# Altium schematic sheet LAN - RTL8111H.schdoc
size 420 x 298 mm; Symbol: Sheet-Symbol_A3; Company: 嘉立创EDA; Version: V1.0; Page Size: A3; @Project Name: 【全网首发】X86电脑主板_copy; @Page Count: 15; @Update Date: 2025-10-09; @Create Date: 2025-10-09; @Schematic Name: SCHEMATIC1_1; @Page No: 0; @Page Name: LAN - RTL8111H; Device: Sheet-Symbol_A3
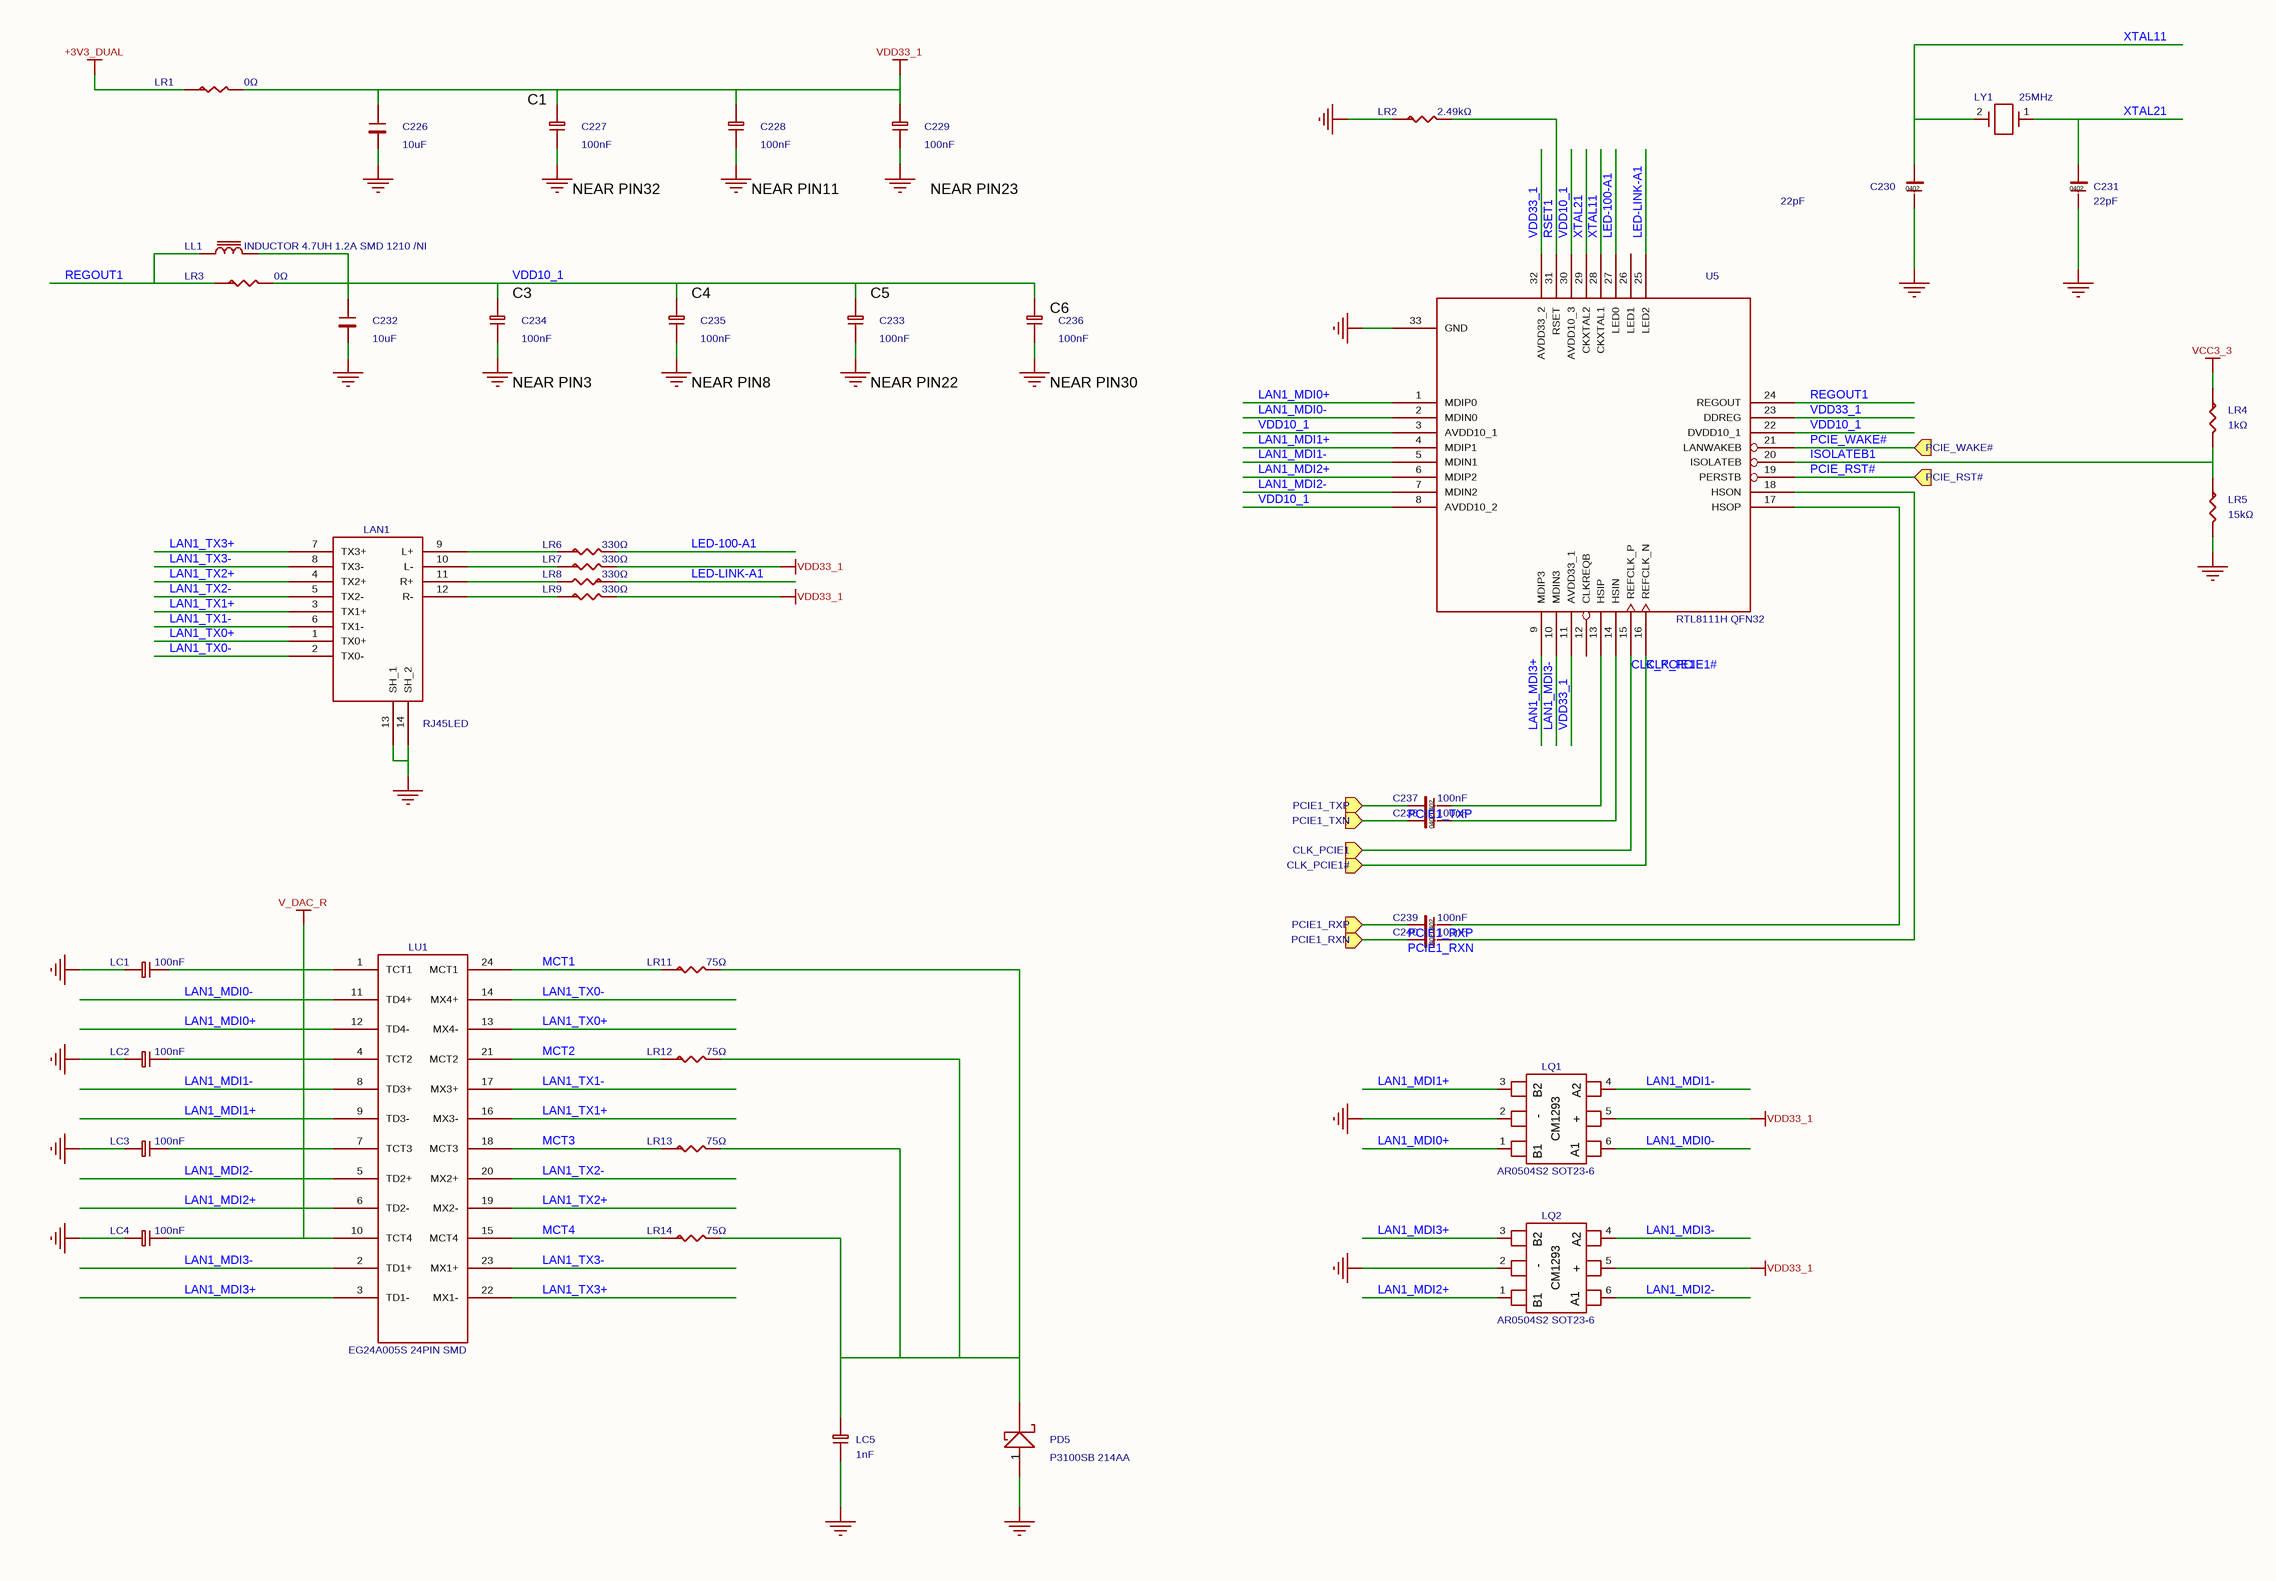
[diagram p0: LAN - RTL8111H.schdoc]

## Parts
C226  10uF  [C0603]
C227  100nF  [C0402]
C228  100nF  [C0402_3]
C229  100nF  [C0402_2]
C230  22pF  [C0402]
C231  22pF  [C0402]
C232  10uF  [C0603_3]
C233  100nF  [C0402_3]
C234  100nF  [C0402_2]
C235  100nF  [C0402_1]
C236  100nF  [C0402_1]
C237  100nF  [C0402_3]
C238  100nF  [C0402_3]
C239  100nF  [C0402_3]
C240  100nF  [C0402_3]
LAN1  value RJ45LED  [RJ45_LED]  (hidden comment: R-RJ45R08P-C000)
LC1  100nF  [C0402]
LC2  100nF  [C0402]
LC3  100nF  [C0402]
LC4  100nF  [C0402]
LC5  1nF  [C1206]
LL1  value INDUCTOR 4.7UH 1.2A SMD 1210 /NI  [L1210H22]  (hidden comment: INDUCTOR_0)
LQ1  value AR0504S2 SOT23-6  [SOT23-6P-20051228]  (hidden comment: SRV05-4)
LQ2  value AR0504S2 SOT23-6  [SOT23-6P-20051228]  (hidden comment: SRV05-4)
LR1  0Ω  [R0603]
LR2  2.49kΩ  [R0402]
LR3  0Ω  [R0603_1]
LR4  1kΩ  [R0402_1]
LR5  15kΩ  [R0402_3]
LR6  330Ω  [R0402_3]
LR7  330Ω  [R0402_1]
LR8  330Ω  [R0402_1]
LR9  330Ω  [R0402_1]
LR11  75Ω  [R0402_3]
LR12  75Ω  [R0402_1]
LR13  75Ω  [R0402_1]
LR14  75Ω  [R0402_1]
LU1  value EG24A005S 24PIN SMD  [TRAN24_100_150]  (hidden comment: RJ45LED_3)
LY1  25MHz  [XD2]
PD5  value P3100SB 214AA  [DIODE_1N5817]  (hidden comment: P3100SB)
U5  value RTL8111H QFN32  [RTL8111G_QFN32]  (hidden comment: RTL8111H-CG)

## Ports
CLK_PCIE1 (in), CLK_PCIE1# (in), PCIE1_RXN (in), PCIE1_RXP (in), PCIE1_TXN (in), PCIE1_TXP (in), PCIE_RST# (in), PCIE_WAKE# (in)

## Nets
+3V3_DUAL: LR1.1
GND: C226.1 C227.1 C228.1 C229.1 C230.2 C231.2 C232.1 C233.1 C234.1 C235.1 C236.1 LAN1.13(SH_1) LAN1.14(SH_2) LC1.2 LC2.2 LC3.2 LC4.2 LC5.1 LQ1.2 LQ2.2 LR2.1 LR5.2 PD5.1(A) U5.33(GND)
V_DAC_R: LC1.1 LC2.1 LC3.1 LC4.1 LU1.1(TCT1) LU1.4(TCT2) LU1.7(TCT3) LU1.10(TCT4)
VCC3_3: LR4.1
VDD33_1: C226.2 C227.2 C228.2 C229.2 LQ1.5(+) LQ2.5(+) LR1.2 LR7.2 LR9.2 U5.11(AVDD33_1) U5.23(DDREG) U5.32(AVDD33_2)
CLK_PCIE1: U5.15(REFCLK_P) ; port CLK_PCIE1
CLK_PCIE1#: U5.16(REFCLK_N) ; port CLK_PCIE1#
ISOLATEB1: LR4.2 LR5.1 U5.20(ISOLATEB)
LAN1_MDI0+: LQ1.1 LU1.12(TD4-) U5.1(MDIP0)
LAN1_MDI0-: LQ1.6 LU1.11(TD4+) U5.2(MDIN0)
LAN1_MDI1+: LQ1.3 LU1.9(TD3-) U5.4(MDIP1)
LAN1_MDI1-: LQ1.4 LU1.8(TD3+) U5.5(MDIN1)
LAN1_MDI2+: LQ2.1 LU1.6(TD2-) U5.6(MDIP2)
LAN1_MDI2-: LQ2.6 LU1.5(TD2+) U5.7(MDIN2)
LAN1_MDI3+: LQ2.3 LU1.3(TD1-) U5.9(MDIP3)
LAN1_MDI3-: LQ2.4 LU1.2(TD1+) U5.10(MDIN3)
LAN1_TX0+: LAN1.1(TX0+) LU1.13(MX4-)
LAN1_TX0-: LAN1.2(TX0-) LU1.14(MX4+)
LAN1_TX1+: LAN1.3(TX1+) LU1.16(MX3-)
LAN1_TX1-: LAN1.6(TX1-) LU1.17(MX3+)
LAN1_TX2+: LAN1.4(TX2+) LU1.19(MX2-)
LAN1_TX2-: LAN1.5(TX2-) LU1.20(MX2+)
LAN1_TX3+: LAN1.7(TX3+) LU1.22(MX1-)
LAN1_TX3-: LAN1.8(TX3-) LU1.23(MX1+)
LED-100-A1: LR6.2 U5.27(LED0)
LED-LINK-A1: LR8.1 U5.25(LED2)
MCT1: LR11.1 LU1.24(MCT1)
MCT2: LR12.1 LU1.21(MCT2)
MCT3: LR13.1 LU1.18(MCT3)
MCT4: LR14.1 LU1.15(MCT4)
PCIE1_RXN: C240.1 ; port PCIE1_RXN
PCIE1_RXP: C239.1 ; port PCIE1_RXP
PCIE1_TXN: C238.1 ; port PCIE1_TXN
PCIE1_TXP: C237.1 ; port PCIE1_TXP
PCIE_RST#: U5.19(PERSTB) ; port PCIE_RST#
PCIE_WAKE#: U5.21(LANWAKEB) ; port PCIE_WAKE#
REGOUT1: LL1.1 LR3.1 U5.24(REGOUT)
RSET1: LR2.2 U5.31(RSET)
VDD10_1: C232.2 C233.2 C234.2 C235.2 C236.2 LL1.2 LR3.2 U5.3(AVDD10_1) U5.8(AVDD10_2) U5.22(DVDD10_1) U5.30(AVDD10_3)
XTAL11: C230.1 LY1.2 U5.28(CKXTAL1)
XTAL21: C231.1 LY1.1 U5.29(CKXTAL2)
NetC237_2: C237.2 U5.13(HSIP)
NetC238_2: C238.2 U5.14(HSIN)
NetC239_2: C239.2 U5.17(HSOP)
NetC240_2: C240.2 U5.18(HSON)
NetLAN1_9: LAN1.9(L+) LR6.1
NetLAN1_10: LAN1.10(L-) LR7.1
NetLAN1_11: LAN1.11(R+) LR8.2
NetLAN1_12: LAN1.12(R-) LR9.1
NetLC5_2: LC5.2 LR11.2 LR12.2 LR13.2 LR14.2 PD5.2(C)

Not connected (* = marked no-connect by the designer): U5 12(CLKREQB) 26(LED1)

## Notes on the sheet
- (near C227) C1
- (near C227) NEAR PIN32
- (near C228) NEAR PIN11
- (near C229) NEAR PIN23
- (near C234) C3
- (near C235) C4
- (near C233) C5
- (near C236) C6
- (near C234) NEAR PIN3
- (near C235) NEAR PIN8
- (near C233) NEAR PIN22
- (near C236) NEAR PIN30
- 更新日期
- 2025-10-09
- 原理图
- 图页
- SCHEMATIC1_1
- LAN - RTL8111H
- 创建日期
- 物料编码
- 审阅
- 绘制
- 【全网首发】X86电脑主板_copy
- 版本
- V1.0
- 尺寸
- A3
- 页
- 0
- 嘉立创EDA
- 共
- 15
- (in symbol SRV05-4_C558418) B2; A2; CM1293; -; B1; A1

## Library data of the parts
C226 C232 = CL10A106KP8NNNC: 容值:10uF;精度:±10%;额定电压:10V;材质(温度系数):X5R;; Manufacturer: SAMSUNG(三星); Symbol: C0805; ModelId: ac125912035d415993ca9572d50418b1; Tolerance: ±10%; AddInBom: yes; Voltage Rated: 10V; ModelName: C0603_L1.6-W0.8-H0.8; ModelTransform: 62.992,31.496,0,0,0,0,0,0,0; Temperature Coefficient: X5R; Device: CL10A106KP8NNNC; Value: 10uF; Supplier: LCSC; Datasheet: https://atta.szlcsc.com/upload/public/pdf/source/20160103/1457707703378.pdf; SupplierPart: C19702; ConvertToPcb: yes; LCSC Part Name: 10uF ±10% 10V; JLCPCB Part Class: Basic Part; ManufacturerPart: CL10A106KP8NNNC; Supplier Footprint: 0603
  C226: FootprintName: C0603
  C232: FootprintName: C0603_3
C227-C229 C233-C236 LC1-LC4 = CC0402KRX7R7BB104: 容值:100nF;精度:±10%;额定电压:16V;材质(温度系数):X7R;; Manufacturer: YAGEO(国巨); Symbol: CAP NP_21; ModelId: 36a51122f27c49738f86b3bfa98863e0; Tolerance: ±10%; AddInBom: yes; Voltage Rated: 16V; ModelName: C0402_L1.0-W0.5-H0.5; ModelTransform: 39.37,19.685,0,0,0,0,0,0,0; Temperature Coefficient: X7R; Device: CC0402KRX7R7BB104; Value: 100nF; Supplier: LCSC; Datasheet: https://atta.szlcsc.com/upload/public/pdf/source/20211223/9278FD768280B81DDBEF48FA36411A03.pdf; SupplierPart: C60474; ConvertToPcb: yes; LCSC Part Name: 100nF ±10% 16V; JLCPCB Part Class: Extended Part; ManufacturerPart: CC0402KRX7R7BB104; Supplier Footprint: 0402
  C227 LC1-LC4: FootprintName: C0402
  C228 C233: FootprintName: C0402_3
  C229 C234: FootprintName: C0402_2
  C235 C236: FootprintName: C0402_1
C230 C231 = 0402CG220J500NT: 容值:22pF;精度:±5%;额定电压:50V;材质(温度系数):C0G;; Manufacturer: FH(风华); ModelId: 36a51122f27c49738f86b3bfa98863e0; Tolerance: ±5%; AddInBom: yes; Voltage Rated: 50V; ModelName: C0402_L1.0-W0.5-H0.5; ModelTransform: 39.37,19.685,0,0,0,0,0,0,0; Temperature Coefficient: C0G; Device: 0402CG220J500NT; Symbol: C0402; Value: 22pF; Supplier: LCSC; Datasheet: https://atta.szlcsc.com/upload/public/pdf/source/20200305/C486355_26A10D38EF8C2A5C37091D0039909270.pdf; FootprintName: C0402; SupplierPart: C1555; ConvertToPcb: yes; LCSC Part Name: 22pF ±5% 50V; JLCPCB Part Class: Basic Part; ManufacturerPart: 0402CG220J500NT; Supplier Footprint: 0402
C237-C240 = CL05B104KO5NNNC: 容值:100nF;精度:±10%;额定电压:16V;材质(温度系数):X7R;; Manufacturer: SAMSUNG(三星); Symbol: C0402; ModelId: 36a51122f27c49738f86b3bfa98863e0; Tolerance: ±10%; AddInBom: yes; Voltage Rated: 16V; ModelName: C0402_L1.0-W0.5-H0.5; ModelTransform: 39.37,19.685,0,0,0,0,0,0,0; Temperature Coefficient: X7R; Device: CL05B104KO5NNNC; Value: 100nF; Supplier: LCSC; Datasheet: https://atta.szlcsc.com/upload/public/pdf/source/20160103/1457707674891.pdf; FootprintName: C0402_3; SupplierPart: C1525; ConvertToPcb: yes; LCSC Part Name: 100nF ±10% 16V; JLCPCB Part Class: Basic Part; ManufacturerPart: CL05B104KO5NNNC; Supplier Footprint: 0402
LAN1 = R-RJ45R08P-C000: 连接器类型:RJ插座;USOC代码:RJ45;端口数量:1;等级:-;安装方式:弯插;屏蔽:有;LED:带LED;工作温度范围:0℃~+70℃;; Manufacturer: Ckmtw(灿科盟); Symbol: RJ45LED_0; LED: 带LED; ModelId: 7d68f79fef814152a52c058157038b8b; Shielding: 有; USOC Codes: RJ45; AddInBom: yes; ModelName: RJ45-TH_L16.3-W15.8-H13.1; Connector Type: RJ插座; Number of Ports: 1; ModelTransform: 647.6365,631.889,0,0,0,0,0,-129.921,-137.795; Device: R-RJ45R08P-C000; Ratings: -; Supplier: LCSC; Datasheet: https://atta.szlcsc.com/upload/public/pdf/source/20190508/C386757_590BCC8A33AAEEF7838490D656B2E4CF.pdf; FootprintName: RJ45_LED; SupplierPart: C386757; ConvertToPcb: yes; LCSC Part Name: RJ45 弯插 带LED 8P/8C 铜壳带屏蔽 短体  无弹片; Mounting Style: 弯插; JLCPCB Part Class: Extended Part; ManufacturerPart: R-RJ45R08P-C000; Supplier Footprint: 插件; Operating Temperature Range: 0℃~+70℃
LC5 = 1206B102K202NT: 容值:1nF;精度:±10%;额定电压:2kV;材质(温度系数):X7R;; Manufacturer: FH(风华); Symbol: CAP NP_21; ModelId: e4be705b945545a48e666415e3682bd8; Tolerance: ±10%; AddInBom: yes; Voltage Rated: 2kV; ModelName: C1206_L3.2-W1.6-H1.3; ModelTransform: 125.984,62.992,0,0,0,0,0,0,0; Temperature Coefficient: X7R; Device: 1206B102K202NT; Value: 1nF; Supplier: LCSC; Datasheet: https://atta.szlcsc.com/upload/public/pdf/source/20170923/C9196_1506149572183988986.pdf; FootprintName: C1206; SupplierPart: C9196; ConvertToPcb: yes; LCSC Part Name: 1nF ±10% 2kV; JLCPCB Part Class: Basic Part; ManufacturerPart: 1206B102K202NT; Supplier Footprint: 1206
LL1 = INDUCTOR_0: Manufacturer: UNI-ROYAL(厚声); Manufacturer Part: 0603WAF0000T5E; 3D Model: fc143cca1e79419f9cd78b61e9279f08; 3D Model Transform: 31.8897,63.7794,0,90,0,0,0,0,0; Tolerance: ±1%; Power(Watts): 100mW; Overload Voltage (Max): 75V; AddInBom: yes; Device: INDUCTOR_0; Symbol: INDUCTOR_0; LCSC Part Name: 0Ω ±1% 100mW 厚膜电阻; Supplier Part: C21189; Supplier Footprint: 0603; JLCPCB Part Class: Basic Part; Datasheet: https://atta.szlcsc.com/upload/public/pdf/source/20200306/C422600_1E6D84923E4A46A82E41ADD87F860B5C.pdf; Supplier: LCSC; Type: 厚膜电阻; Operating Temperature Range: -55℃~+155℃; FootprintName: L1210H22; ConvertToPcb: yes
LQ1 LQ2 = SRV05-4_C558418: 反向截止电压(Vrwm):5V;最大钳位电压:20V;峰值脉冲电流(Ipp)@10/1000us:3A;击穿电压:6V;; Manufacturer: TECH PUBLIC(台舟); Symbol: CM1293_0; AddInBom: yes; ModelId: 18da8f6c14a34920b3e136b5c401a119; ModelName: SOT-23-6_L2.9-W1.6-H1.5-LS2.8-P0.95; ModelTransform: 110.236,113.364,0,90,0,0,0.0005,0.0005,0; Reverse Stand-Off Voltage (Vrwm): 5V; Maximum Clamping Voltage: 20V; Peak Pulse Current (Ipp)@10/1000us: 3A; Breakdown Voltage: 6V; Device: SRV05-4_C558418; LCSC Part Name: ESD，可防25kV静电; SupplierPart: C558418; ManufacturerPart: SRV05-4; Supplier Footprint: SOT-23-6; JLCPCB Part Class: Extended Part; Datasheet: https://atta.szlcsc.com/upload/public/pdf/source/20230615/CFFDFFE99FDA0E92DF9600783B3A2A20.pdf; Supplier: LCSC; ConvertToPcb: yes; FootprintName: SOT23-6P-20051228; Type: ESD
LR1 = 0603WAF0000T5E: 电阻类型:厚膜电阻;阻值:0Ω;精度:±1%;功率:100mW;; Manufacturer: UNI-ROYAL(厚声); Symbol: R-0603; ModelId: fc143cca1e79419f9cd78b61e9279f08; Tolerance: ±1%; AddInBom: yes; Power(Watts): 100mW; ModelTransform: 31.8897,63.7794,0,90,0,0,0,0,0; Overload Voltage (Max): 75V; Device: 0603WAF0000T5E; Value: 0Ω; Type: 厚膜电阻; Supplier: LCSC; Datasheet: https://atta.szlcsc.com/upload/public/pdf/source/20200306/C422600_1E6D84923E4A46A82E41ADD87F860B5C.pdf; FootprintName: R0603; SupplierPart: C21189; ModelName: R0603; ConvertToPcb: yes; LCSC Part Name: 0Ω ±1% 100mW; JLCPCB Part Class: Basic Part; ManufacturerPart: 0603WAF0000T5E; Supplier Footprint: 0603; Operating Temperature Range: -55℃~+155℃
LR2 = 0402WGF2491TCE: 电阻类型:厚膜电阻;阻值:2.49kΩ;精度:±1%;功率:62.5mW;; Manufacturer: UNI-ROYAL(厚声); Symbol: R-0603; ModelId: 671aefced39d4c318694bba8bd8efd39; Tolerance: ±1%; AddInBom: yes; Power(Watts): 62.5mW; ModelName: R0402_L1.0-W0.5-H0.5; ModelTransform: 39.37,19.685,0,0,0,0,0,0.0005,0; Overload Voltage (Max): 50V; Temperature Coefficient: ±100ppm/℃; Device: 0402WGF2491TCE; Value: 2.49kΩ; Type: 厚膜电阻; Supplier: LCSC; Datasheet: https://atta.szlcsc.com/upload/public/pdf/source/20200306/C422600_1E6D84923E4A46A82E41ADD87F860B5C.pdf; FootprintName: R0402; SupplierPart: C25884; ConvertToPcb: yes; LCSC Part Name: 2.49kΩ ±1% 62.5mW; JLCPCB Part Class: Extended Part; ManufacturerPart: 0402WGF2491TCE; Supplier Footprint: 0402; Operating Temperature Range: -55℃~+155℃
LR3 = 0603WAF0000T5E: 电阻类型:厚膜电阻;阻值:0Ω;精度:±1%;功率:100mW;; Manufacturer: UNI-ROYAL(厚声); Symbol: R-0603; ModelId: fc143cca1e79419f9cd78b61e9279f08; Tolerance: ±1%; AddInBom: yes; Power(Watts): 100mW; ModelName: R0603; ModelTransform: 31.8897,63.7794,0,90,0,0,0,0,0; Overload Voltage (Max): 75V; Device: 0603WAF0000T5E; Value: 0Ω; Type: 厚膜电阻; Supplier: LCSC; Datasheet: https://atta.szlcsc.com/upload/public/pdf/source/20200306/C422600_1E6D84923E4A46A82E41ADD87F860B5C.pdf; FootprintName: R0603_1; SupplierPart: C21189; ConvertToPcb: yes; LCSC Part Name: 0Ω ±1% 100mW; JLCPCB Part Class: Basic Part; ManufacturerPart: 0603WAF0000T5E; Supplier Footprint: 0603; Operating Temperature Range: -55℃~+155℃
LR4 = 0402WGF1001TCE: 电阻类型:厚膜电阻;阻值:1kΩ;精度:±1%;功率:62.5mW;; Manufacturer: UNI-ROYAL(厚声); Symbol: R-0603; ModelId: 671aefced39d4c318694bba8bd8efd39; Tolerance: ±1%; AddInBom: yes; Power(Watts): 62.5mW; ModelName: R0402_L1.0-W0.5-H0.5; ModelTransform: 39.37,19.685,0,0,0,0,0,0.0005,0; Overload Voltage (Max): 50V; Temperature Coefficient: ±100ppm/℃; Device: 0402WGF1001TCE; Value: 1kΩ; Type: 厚膜电阻; Supplier: LCSC; Datasheet: https://atta.szlcsc.com/upload/public/pdf/source/20200306/C422600_1E6D84923E4A46A82E41ADD87F860B5C.pdf; FootprintName: R0402_1; SupplierPart: C11702; ConvertToPcb: yes; LCSC Part Name: 1kΩ ±1% 62.5mW; JLCPCB Part Class: Basic Part; ManufacturerPart: 0402WGF1001TCE; Supplier Footprint: 0402; Operating Temperature Range: -55℃~+155℃
LR5 = 0402WGF1502TCE: 电阻类型:厚膜电阻;阻值:15kΩ;精度:±1%;功率:62.5mW;; Manufacturer: UNI-ROYAL(厚声); Symbol: R-0603; ModelId: 671aefced39d4c318694bba8bd8efd39; Tolerance: ±1%; AddInBom: yes; Power(Watts): 62.5mW; ModelName: R0402_L1.0-W0.5-H0.5; ModelTransform: 39.37,19.685,0,0,0,0,0,0.0005,0; Overload Voltage (Max): 50V; Temperature Coefficient: ±100ppm/℃; Device: 0402WGF1502TCE; Value: 15kΩ; Type: 厚膜电阻; Supplier: LCSC; Datasheet: https://atta.szlcsc.com/upload/public/pdf/source/20200306/C422600_1E6D84923E4A46A82E41ADD87F860B5C.pdf; FootprintName: R0402_3; SupplierPart: C25756; ConvertToPcb: yes; LCSC Part Name: 15kΩ ±1% 62.5mW; JLCPCB Part Class: Basic Part; ManufacturerPart: 0402WGF1502TCE; Supplier Footprint: 0402; Operating Temperature Range: -55℃~+155℃
LR6-LR9 = 0402WGF3300TCE: 电阻类型:厚膜电阻;阻值:330Ω;精度:±1%;功率:62.5mW;; Manufacturer: UNI-ROYAL(厚声); Symbol: R-0603; ModelId: 671aefced39d4c318694bba8bd8efd39; Tolerance: ±1%; AddInBom: yes; Power(Watts): 62.5mW; ModelName: R0402_L1.0-W0.5-H0.5; ModelTransform: 39.37,19.685,0,0,0,0,0,0.0005,0; Overload Voltage (Max): 50V; Temperature Coefficient: ±100ppm/℃; Device: 0402WGF3300TCE; Value: 330Ω; Type: 厚膜电阻; Supplier: LCSC; Datasheet: https://atta.szlcsc.com/upload/public/pdf/source/20200306/C422600_1E6D84923E4A46A82E41ADD87F860B5C.pdf; SupplierPart: C25104; ConvertToPcb: yes; LCSC Part Name: 330Ω ±1% 62.5mW; JLCPCB Part Class: Basic Part; ManufacturerPart: 0402WGF3300TCE; Supplier Footprint: 0402; Operating Temperature Range: -55℃~+155℃
  LR6: FootprintName: R0402_3
  LR7-LR9: FootprintName: R0402_1
LR11-LR14 = 0402WGF750JTCE: 电阻类型:厚膜电阻;阻值:75Ω;精度:±1%;功率:62.5mW;; Manufacturer: UNI-ROYAL(厚声); Symbol: R-0603; ModelId: 671aefced39d4c318694bba8bd8efd39; Tolerance: ±1%; AddInBom: yes; Power(Watts): 62.5mW; ModelName: R0402_L1.0-W0.5-H0.5; ModelTransform: 39.37,19.685,0,0,0,0,0,0.0005,0; Overload Voltage (Max): 50V; Temperature Coefficient: ±100ppm/℃; Device: 0402WGF750JTCE; Value: 75Ω; Type: 厚膜电阻; Supplier: LCSC; Datasheet: https://atta.szlcsc.com/upload/public/pdf/source/20200306/C422600_1E6D84923E4A46A82E41ADD87F860B5C.pdf; SupplierPart: C25133; ConvertToPcb: yes; LCSC Part Name: 75Ω ±1% 62.5mW; JLCPCB Part Class: Basic Part; ManufacturerPart: 0402WGF750JTCE; Supplier Footprint: 0402; Operating Temperature Range: -55℃~+155℃
  LR11: FootprintName: R0402_3
  LR12-LR14: FootprintName: R0402_1
LU1 = RJ45LED_3: AddInBom: yes; Device: RJ45LED_3; Symbol: RJ45LED_3; Supplier Part: C9900052919; FootprintName: TRAN24_100_150; ConvertToPcb: yes
LY1 = X49SD25MSD2SC: 频率:25MHz;频率公差:±20ppm;负载电容:20pF;; Manufacturer: YXC(扬兴晶振); Symbol: CRYSTAL_0; ModelId: a8e34f6c394c4d60ace7720f62d1ccdf; AddInBom: yes; Crystal Type: 49S晶振; ModelName: HC-49US_L11.0-W4.5-H3.5-P4.88; Load Capacitance: 20pF; ModelTransform: 432.46488,177.165,0,0,0,0,0,0,-137.795; Frequency Stability: ±30ppm; Frequency Tolerance: ±20ppm; Device: X49SD25MSD2SC; Value: 25MHz; Supplier: LCSC; Datasheet: https://atta.szlcsc.com/upload/public/pdf/source/20210903/A997D130AE99CBB55D9024F9BE6DA174.pdf; FootprintName: XD2; SupplierPart: C14730; ConvertToPcb: yes; LCSC Part Name: 25MHz ±20ppm 20pF HC-49US; JLCPCB Part Class: Extended Part; ManufacturerPart: X49SD25MSD2SC; Supplier Footprint: HC-49S; Operating Temperature: -20℃~+70℃
PD5 = P3100SB_C3012560: 断态峰值电压(Vdrm):275V;开关电压(Vs):350V;漏电流(Idrm):5uA;维持电流(Ih):120mA;; Manufacturer: PAKER(派克微); Symbol: DIODE SCHOTTKY; AddInBom: yes; ModelId: 07b8d28694b84373acb83e050c4644c9; ModelName: SMB_L4.6-W3.6-LS5.3-BI; ModelTransform: 212.598,141.732,0,0,0,0,0,0,0; Peak off-state voltage: 275V; Switching Voltage (Vs): 350V; Peak Pulse Current-Ipp (10/1000us): 80A; Off-state current: 5uA; Holding Current (Ih): 120mA; On-state Voltage (Vt): 4V; On-state Current (It): 2.2A; Off-state Capacitance (Co): 52pF; Device: P3100SB_C3012560; PCB Footprint: DIODE_1N5817; LCSC Part Name: P3100SB; SupplierPart: C3012560; ManufacturerPart: P3100SB; Supplier Footprint: SMB; JLCPCB Part Class: Extended Part; Datasheet: https://atta.szlcsc.com/upload/public/pdf/source/20220607/CB91779BA710CEF1D2CD73D5C8C563CB.pdf; Supplier: LCSC; ConvertToPcb: yes; FootprintName: DIODE_1N5817
U5 = RTL8111H-CG: Manufacturer: REALTEK(瑞昱); Symbol: RL5877_0; AddInBom: yes; ModelId: c3a043996fff46968cb9e2e6abede9b6; ModelName: QFN-32_L4.0-W4.0-H0.8-P0.40-BL-EP2.8; ModelTransform: 157.48,157.48,0,0,0,0,-0.002,-0.007,0; Device: RTL8111H-CG; LCSC Part Name: RTL8111H-CG; SupplierPart: C2761340; ManufacturerPart: RTL8111H-CG; Supplier Footprint: QFN-32-EP(4x4); JLCPCB Part Class: Extended Part; Datasheet: https://atta.szlcsc.com/upload/public/pdf/source/20210810/FF05C5D46F518898BC2EC053E52D54B5.pdf; Supplier: LCSC; ConvertToPcb: yes; FootprintName: RTL8111G_QFN32